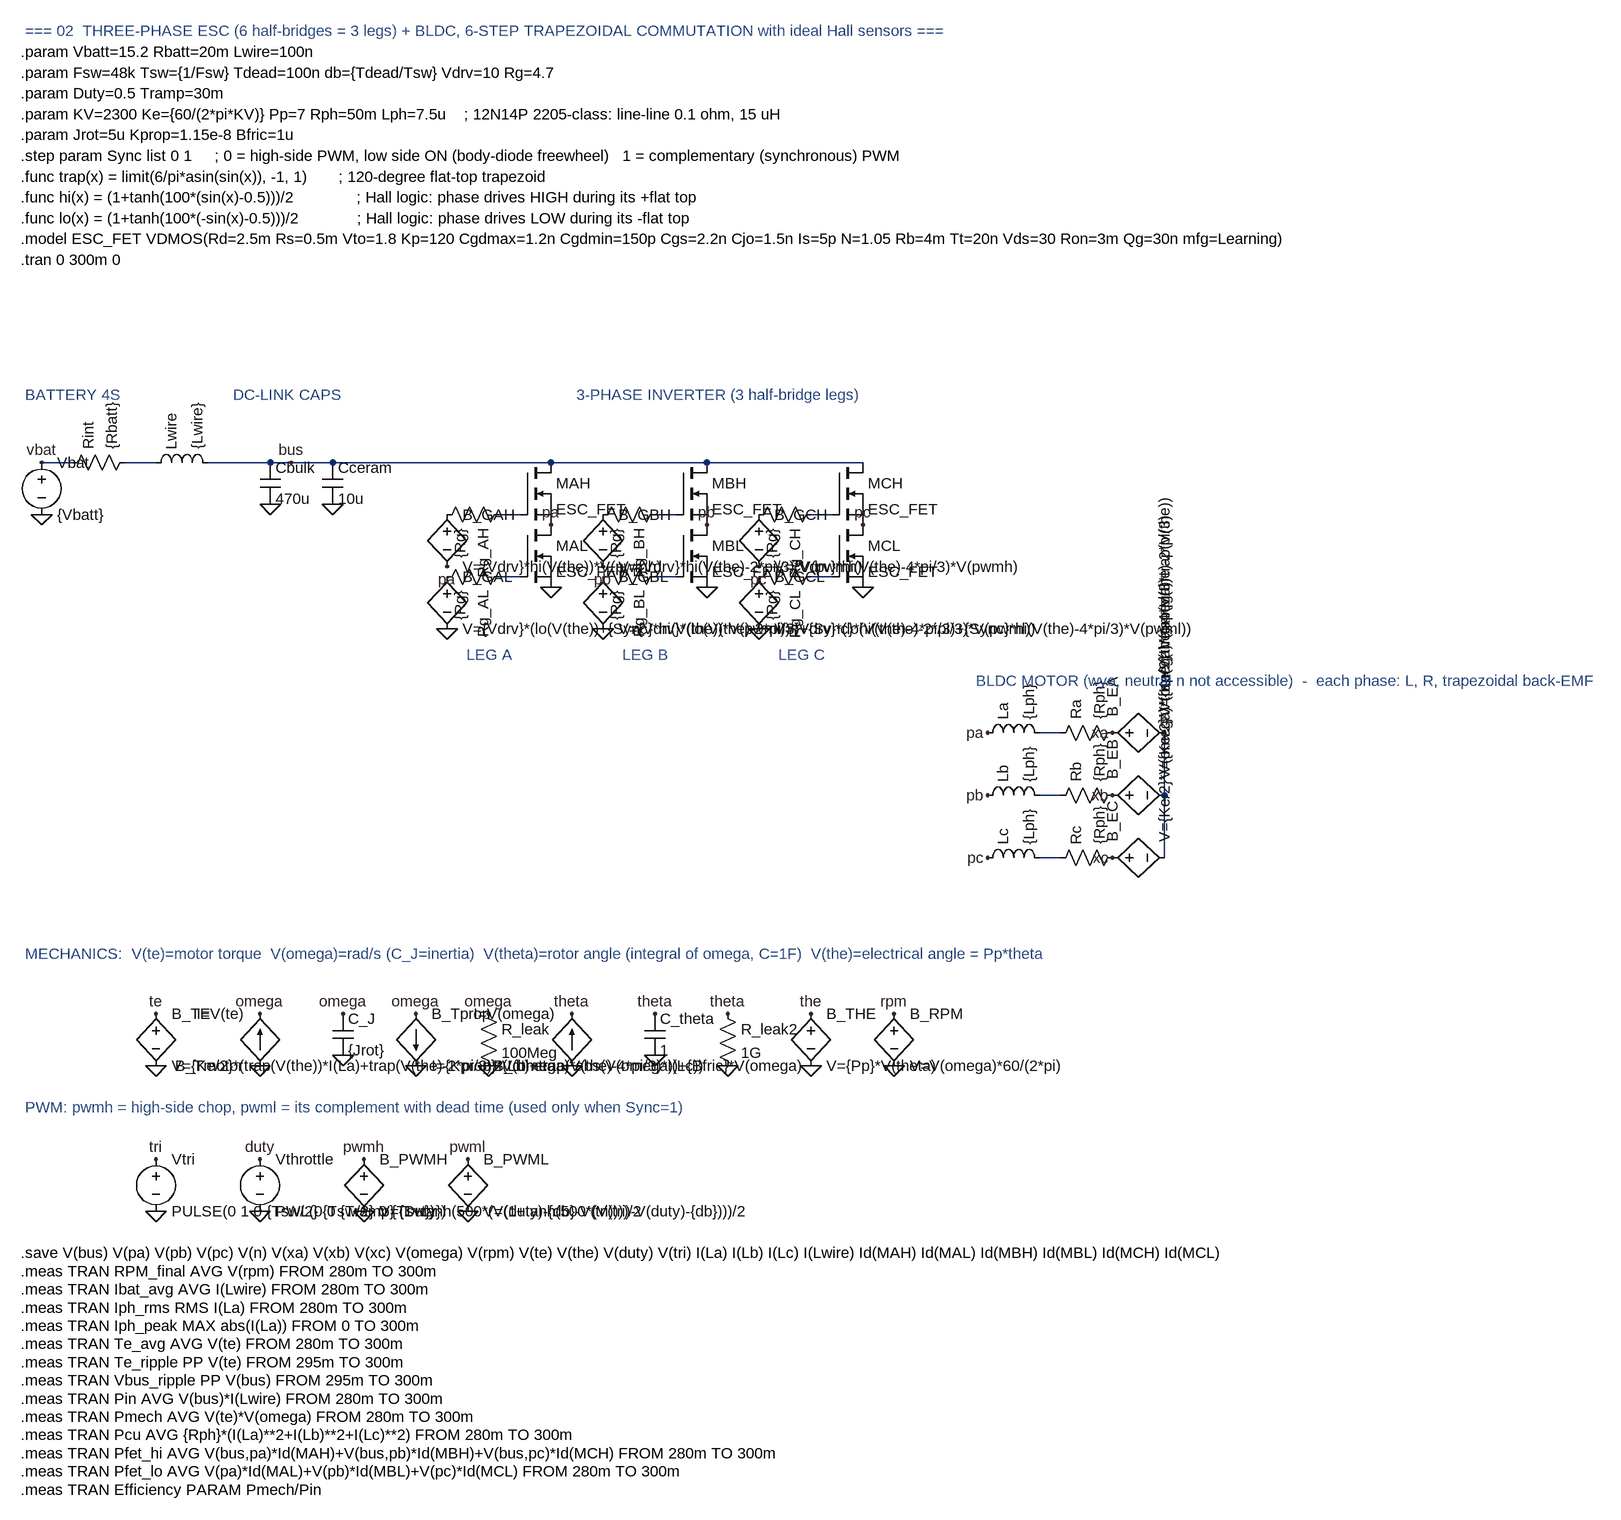
[diagram p0: schematic ThreePhase_ESC_BLDC.asc]
ThreePhase_ESC_BLDC.asc, the LTspice schematic file:
Version 4
SHEET 1 2200 1500
SYMBOL voltage 64 128 R0
SYMATTR InstName Vbat
SYMATTR Value {Vbatt}
FLAG 64 224 0
FLAG 64 144 vbat
SYMBOL res 96 160 R270
SYMATTR InstName Rint
SYMATTR Value {Rbatt}
WIRE 64 144 112 144
SYMBOL ind 224 160 R270
SYMATTR InstName Lwire
SYMATTR Value {Lwire}
SYMATTR SpiceLine Rser=2m
WIRE 192 144 240 144
SYMBOL cap 400 144 R0
SYMATTR InstName Cbulk
SYMATTR Value 470u
SYMATTR SpiceLine Rser=30m Lser=10n
FLAG 416 208 0
SYMBOL cap 496 144 R0
SYMATTR InstName Cceram
SYMATTR Value 10u
SYMATTR SpiceLine Rser=2m
FLAG 512 208 0
WIRE 320 144 1328 144
FLAG 448 144 bus
SYMBOL nmos 800 144 R0
SYMATTR InstName MAH
SYMATTR Value ESC_FET
SYMBOL nmos 800 240 R0
SYMATTR InstName MAL
SYMATTR Value ESC_FET
FLAG 848 336 0
FLAG 848 240 pa
SYMBOL res 784 208 R90
SYMATTR InstName Rg_AH
SYMATTR Value {Rg}
WIRE 768 224 800 224
SYMBOL res 784 304 R90
SYMATTR InstName Rg_AL
SYMATTR Value {Rg}
WIRE 768 320 800 320
SYMBOL bv 688 208 R0
SYMATTR InstName B_GAH
SYMATTR Value V={Vdrv}*hi(V(the))*V(pwmh)
FLAG 688 304 pa
SYMBOL bv 688 304 R0
SYMATTR InstName B_GAL
SYMATTR Value V={Vdrv}*(lo(V(the))+{Sync}*hi(V(the))*V(pwml))
FLAG 688 400 0
TEXT 704 440 Left 2 ;  LEG A
SYMBOL nmos 1040 144 R0
SYMATTR InstName MBH
SYMATTR Value ESC_FET
SYMBOL nmos 1040 240 R0
SYMATTR InstName MBL
SYMATTR Value ESC_FET
FLAG 1088 336 0
FLAG 1088 240 pb
SYMBOL res 1024 208 R90
SYMATTR InstName Rg_BH
SYMATTR Value {Rg}
WIRE 1008 224 1040 224
SYMBOL res 1024 304 R90
SYMATTR InstName Rg_BL
SYMATTR Value {Rg}
WIRE 1008 320 1040 320
SYMBOL bv 928 208 R0
SYMATTR InstName B_GBH
SYMATTR Value V={Vdrv}*hi(V(the)-2*pi/3)*V(pwmh)
FLAG 928 304 pb
SYMBOL bv 928 304 R0
SYMATTR InstName B_GBL
SYMATTR Value V={Vdrv}*(lo(V(the)-2*pi/3)+{Sync}*hi(V(the)-2*pi/3)*V(pwml))
FLAG 928 400 0
TEXT 944 440 Left 2 ;  LEG B
SYMBOL nmos 1280 144 R0
SYMATTR InstName MCH
SYMATTR Value ESC_FET
SYMBOL nmos 1280 240 R0
SYMATTR InstName MCL
SYMATTR Value ESC_FET
FLAG 1328 336 0
FLAG 1328 240 pc
SYMBOL res 1264 208 R90
SYMATTR InstName Rg_CH
SYMATTR Value {Rg}
WIRE 1248 224 1280 224
SYMBOL res 1264 304 R90
SYMATTR InstName Rg_CL
SYMATTR Value {Rg}
WIRE 1248 320 1280 320
SYMBOL bv 1168 208 R0
SYMATTR InstName B_GCH
SYMATTR Value V={Vdrv}*hi(V(the)-4*pi/3)*V(pwmh)
FLAG 1168 304 pc
SYMBOL bv 1168 304 R0
SYMATTR InstName B_GCL
SYMATTR Value V={Vdrv}*(lo(V(the)-4*pi/3)+{Sync}*hi(V(the)-4*pi/3)*V(pwml))
FLAG 1168 400 0
TEXT 1184 440 Left 2 ;  LEG C
FLAG 1520 560 pa
SYMBOL ind 1504 576 R270
SYMATTR InstName La
SYMATTR Value {Lph}
SYMBOL res 1616 576 R270
SYMATTR InstName Ra
SYMATTR Value {Rph}
WIRE 1600 560 1632 560
FLAG 1712 560 xa
SYMBOL bv 1696 560 R270
SYMATTR InstName B_EA
SYMATTR Value V={Ke/2}*V(omega)*trap(V(the))
FLAG 1520 656 pb
SYMBOL ind 1504 672 R270
SYMATTR InstName Lb
SYMATTR Value {Lph}
SYMBOL res 1616 672 R270
SYMATTR InstName Rb
SYMATTR Value {Rph}
WIRE 1600 656 1632 656
FLAG 1712 656 xb
SYMBOL bv 1696 656 R270
SYMATTR InstName B_EB
SYMATTR Value V={Ke/2}*V(omega)*trap(V(the)-2*pi/3)
FLAG 1520 752 pc
SYMBOL ind 1504 768 R270
SYMATTR InstName Lc
SYMATTR Value {Lph}
SYMBOL res 1616 768 R270
SYMATTR InstName Rc
SYMATTR Value {Rph}
WIRE 1600 752 1632 752
FLAG 1712 752 xc
SYMBOL bv 1696 752 R270
SYMATTR InstName B_EC
SYMATTR Value V={Ke/2}*V(omega)*trap(V(the)-4*pi/3)
WIRE 1792 560 1792 752
FLAG 1792 560 n
TEXT 1488 480 Left 2 ;  BLDC MOTOR (wye, neutral n not accessible)  -  each phase: L, R, trapezoidal back-EMF
SYMBOL bv 240 976 R0
SYMATTR InstName B_TE
SYMATTR Value V={Ke/2}*(trap(V(the))*I(La)+trap(V(the)-2*pi/3)*I(Lb)+trap(V(the)-4*pi/3)*I(Lc))
FLAG 240 992 te
FLAG 240 1072 0
SYMBOL bi 400 1072 R180
SYMATTR InstName B_Tmotor
SYMATTR Value I=V(te)
FLAG 400 1072 0
FLAG 400 992 omega
SYMBOL cap 512 992 R0
SYMATTR InstName C_J
SYMATTR Value {Jrot}
FLAG 528 992 omega
FLAG 528 1056 0
SYMBOL bi 640 992 R0
SYMATTR InstName B_Tprop
SYMATTR Value I={Kprop}*V(omega)*abs(V(omega))+{Bfric}*V(omega)
FLAG 640 992 omega
FLAG 640 1072 0
SYMBOL res 736 976 R0
SYMATTR InstName R_leak
SYMATTR Value 100Meg
FLAG 752 992 omega
FLAG 752 1072 0
SYMBOL bi 880 1072 R180
SYMATTR InstName B_dtheta
SYMATTR Value I=V(omega)
FLAG 880 1072 0
FLAG 880 992 theta
SYMBOL cap 992 992 R0
SYMATTR InstName C_theta
SYMATTR Value 1
FLAG 1008 992 theta
FLAG 1008 1056 0
SYMBOL res 1104 976 R0
SYMATTR InstName R_leak2
SYMATTR Value 1G
FLAG 1120 992 theta
FLAG 1120 1072 0
SYMBOL bv 1248 976 R0
SYMATTR InstName B_THE
SYMATTR Value V={Pp}*V(theta)
FLAG 1248 992 the
FLAG 1248 1072 0
SYMBOL bv 1376 976 R0
SYMATTR InstName B_RPM
SYMATTR Value V=V(omega)*60/(2*pi)
FLAG 1376 992 rpm
FLAG 1376 1072 0
TEXT 32 900 Left 2 ; MECHANICS:  V(te)=motor torque  V(omega)=rad/s (C_J=inertia)  V(theta)=rotor angle (integral of omega, C=1F)  V(the)=electrical angle = Pp*theta
SYMBOL voltage 240 1200 R0
SYMATTR InstName Vtri
SYMATTR Value PULSE(0 1 0 {Tsw/2} {Tsw/2} 0 {Tsw})
FLAG 240 1216 tri
FLAG 240 1296 0
SYMBOL voltage 400 1200 R0
SYMATTR InstName Vthrottle
SYMATTR Value PWL(0 0 {Tramp} {Duty})
FLAG 400 1216 duty
FLAG 400 1296 0
SYMBOL bv 560 1200 R0
SYMATTR InstName B_PWMH
SYMATTR Value V=(1+tanh(500*(V(duty)-{db}-V(tri))))/2
FLAG 560 1216 pwmh
FLAG 560 1296 0
SYMBOL bv 720 1200 R0
SYMATTR InstName B_PWML
SYMATTR Value V=(1+tanh(500*(V(tri)-V(duty)-{db})))/2
FLAG 720 1216 pwml
FLAG 720 1296 0
TEXT 32 1136 Left 2 ; PWM: pwmh = high-side chop, pwml = its complement with dead time (used only when Sync=1)
TEXT 32 -520 Left 2 ; === 02  THREE-PHASE ESC (6 half-bridges = 3 legs) + BLDC, 6-STEP TRAPEZOIDAL COMMUTATION with ideal Hall sensors ===
TEXT 32 -488 Left 2 !.param Vbatt=15.2 Rbatt=20m Lwire=100n
TEXT 32 -456 Left 2 !.param Fsw=48k Tsw={1/Fsw} Tdead=100n db={Tdead/Tsw} Vdrv=10 Rg=4.7
TEXT 32 -424 Left 2 !.param Duty=0.5 Tramp=30m
TEXT 32 -392 Left 2 !.param KV=2300 Ke={60/(2*pi*KV)} Pp=7 Rph=50m Lph=7.5u    ; 12N14P 2205-class: line-line 0.1 ohm, 15 uH
TEXT 32 -360 Left 2 !.param Jrot=5u Kprop=1.15e-8 Bfric=1u
TEXT 32 -328 Left 2 !.step param Sync list 0 1     ; 0 = high-side PWM, low side ON (body-diode freewheel)   1 = complementary (synchronous) PWM
TEXT 32 -296 Left 2 !.func trap(x) = limit(6/pi*asin(sin(x)), -1, 1)       ; 120-degree flat-top trapezoid
TEXT 32 -264 Left 2 !.func hi(x) = (1+tanh(100*(sin(x)-0.5)))/2              ; Hall logic: phase drives HIGH during its +flat top
TEXT 32 -232 Left 2 !.func lo(x) = (1+tanh(100*(-sin(x)-0.5)))/2             ; Hall logic: phase drives LOW during its -flat top
TEXT 32 -200 Left 2 !.model ESC_FET VDMOS(Rd=2.5m Rs=0.5m Vto=1.8 Kp=120 Cgdmax=1.2n Cgdmin=150p Cgs=2.2n Cjo=1.5n Is=5p N=1.05 Rb=4m Tt=20n Vds=30 Ron=3m Qg=30n mfg=Learning)
TEXT 32 -168 Left 2 !.tran 0 300m 0
TEXT 32 1360 Left 2 !.save V(bus) V(pa) V(pb) V(pc) V(n) V(xa) V(xb) V(xc) V(omega) V(rpm) V(te) V(the) V(duty) V(tri) I(La) I(Lb) I(Lc) I(Lwire) Id(MAH) Id(MAL) Id(MBH) Id(MBL) Id(MCH) Id(MCL)
TEXT 32 1388 Left 2 !.meas TRAN RPM_final AVG V(rpm) FROM 280m TO 300m
TEXT 32 1416 Left 2 !.meas TRAN Ibat_avg AVG I(Lwire) FROM 280m TO 300m
TEXT 32 1444 Left 2 !.meas TRAN Iph_rms RMS I(La) FROM 280m TO 300m
TEXT 32 1472 Left 2 !.meas TRAN Iph_peak MAX abs(I(La)) FROM 0 TO 300m
TEXT 32 1500 Left 2 !.meas TRAN Te_avg AVG V(te) FROM 280m TO 300m
TEXT 32 1528 Left 2 !.meas TRAN Te_ripple PP V(te) FROM 295m TO 300m
TEXT 32 1556 Left 2 !.meas TRAN Vbus_ripple PP V(bus) FROM 295m TO 300m
TEXT 32 1584 Left 2 !.meas TRAN Pin AVG V(bus)*I(Lwire) FROM 280m TO 300m
TEXT 32 1612 Left 2 !.meas TRAN Pmech AVG V(te)*V(omega) FROM 280m TO 300m
TEXT 32 1640 Left 2 !.meas TRAN Pcu AVG {Rph}*(I(La)**2+I(Lb)**2+I(Lc)**2) FROM 280m TO 300m
TEXT 32 1668 Left 2 !.meas TRAN Pfet_hi AVG V(bus,pa)*Id(MAH)+V(bus,pb)*Id(MBH)+V(bus,pc)*Id(MCH) FROM 280m TO 300m
TEXT 32 1696 Left 2 !.meas TRAN Pfet_lo AVG V(pa)*Id(MAL)+V(pb)*Id(MBL)+V(pc)*Id(MCL) FROM 280m TO 300m
TEXT 32 1724 Left 2 !.meas TRAN Efficiency PARAM Pmech/Pin
TEXT 32 40 Left 2 ; BATTERY 4S
TEXT 352 40 Left 2 ; DC-LINK CAPS
TEXT 880 40 Left 2 ; 3-PHASE INVERTER (3 half-bridge legs)

The netlist it stands for:
* ThreePhase_ESC_BLDC.asc
Vbat vbat 0 {Vbatt}
Rint vbat N001 {Rbatt}
Lwire N001 bus {Lwire} Rser=2m
Cbulk bus 0 470u Rser=30m Lser=10n
Cceram bus 0 10u Rser=2m
MAH bus N002 pa pa ESC_FET
MAL pa N003 0 0 ESC_FET
Rg_AH N002 P001 {Rg}
Rg_AL N003 P002 {Rg}
B_GAH P001 pa V={Vdrv}*hi(V(the))*V(pwmh)
B_GAL P002 0 V={Vdrv}*(lo(V(the))+{Sync}*hi(V(the))*V(pwml))
MBH bus N004 pb pb ESC_FET
MBL pb N005 0 0 ESC_FET
Rg_BH N004 P003 {Rg}
Rg_BL N005 P004 {Rg}
B_GBH P003 pb V={Vdrv}*hi(V(the)-2*pi/3)*V(pwmh)
B_GBL P004 0 V={Vdrv}*(lo(V(the)-2*pi/3)+{Sync}*hi(V(the)-2*pi/3)*V(pwml))
MCH bus N006 pc pc ESC_FET
MCL pc N007 0 0 ESC_FET
Rg_CH N006 P005 {Rg}
Rg_CL N007 P006 {Rg}
B_GCH P005 pc V={Vdrv}*hi(V(the)-4*pi/3)*V(pwmh)
B_GCL P006 0 V={Vdrv}*(lo(V(the)-4*pi/3)+{Sync}*hi(V(the)-4*pi/3)*V(pwml))
La pa N008 {Lph}
Ra N008 xa {Rph}
B_EA xa n V={Ke/2}*V(omega)*trap(V(the))
Lb pb N009 {Lph}
Rb N009 xb {Rph}
B_EB xb n V={Ke/2}*V(omega)*trap(V(the)-2*pi/3)
Lc pc N010 {Lph}
Rc N010 xc {Rph}
B_EC xc n V={Ke/2}*V(omega)*trap(V(the)-4*pi/3)
B_TE te 0 V={Ke/2}*(trap(V(the))*I(La)+trap(V(the)-2*pi/3)*I(Lb)+trap(V(the)-4*pi/3)*I(Lc))
B_Tmotor 0 omega I=V(te)
C_J omega 0 {Jrot}
B_Tprop omega 0 I={Kprop}*V(omega)*abs(V(omega))+{Bfric}*V(omega)
R_leak omega 0 100Meg
B_dtheta 0 theta I=V(omega)
C_theta theta 0 1
R_leak2 theta 0 1G
B_THE the 0 V={Pp}*V(theta)
B_RPM rpm 0 V=V(omega)*60/(2*pi)
Vtri tri 0 PULSE(0 1 0 {Tsw/2} {Tsw/2} 0 {Tsw})
Vthrottle duty 0 PWL(0 0 {Tramp} {Duty})
B_PWMH pwmh 0 V=(1+tanh(500*(V(duty)-{db}-V(tri))))/2
B_PWML pwml 0 V=(1+tanh(500*(V(tri)-V(duty)-{db})))/2
.model NMOS NMOS
.model PMOS PMOS
.lib standard.mos
*   LEG A
*   LEG B
*   LEG C
*   BLDC MOTOR (wye, neutral n not accessible)  -  each phase: L, R, trapezoidal back-EMF
*  MECHANICS:  V(te)=motor torque  V(omega)=rad/s (C_J=inertia)  V(theta)=rotor angle (integral of omega, C=1F)  V(the)=electrical angle = Pp*theta
*  PWM: pwmh = high-side chop, pwml = its complement with dead time (used only when Sync=1)
*  === 02  THREE-PHASE ESC (6 half-bridges = 3 legs) + BLDC, 6-STEP TRAPEZOIDAL COMMUTATION with ideal Hall sensors ===
.param Vbatt=15.2 Rbatt=20m Lwire=100n
.param Fsw=48k Tsw={1/Fsw} Tdead=100n db={Tdead/Tsw} Vdrv=10 Rg=4.7
.param Duty=0.5 Tramp=30m
.param KV=2300 Ke={60/(2*pi*KV)} Pp=7 Rph=50m Lph=7.5u    ; 12N14P 2205-class: line-line 0.1 ohm, 15 uH
.param Jrot=5u Kprop=1.15e-8 Bfric=1u
.step param Sync list 0 1     ; 0 = high-side PWM, low side ON (body-diode freewheel)   1 = complementary (synchronous) PWM
.func trap(x) = limit(6/pi*asin(sin(x)), -1, 1)       ; 120-degree flat-top trapezoid
.func hi(x) = (1+tanh(100*(sin(x)-0.5)))/2              ; Hall logic: phase drives HIGH during its +flat top
.func lo(x) = (1+tanh(100*(-sin(x)-0.5)))/2             ; Hall logic: phase drives LOW during its -flat top
.model ESC_FET VDMOS(Rd=2.5m Rs=0.5m Vto=1.8 Kp=120 Cgdmax=1.2n Cgdmin=150p Cgs=2.2n Cjo=1.5n Is=5p N=1.05 Rb=4m Tt=20n Vds=30 Ron=3m Qg=30n mfg=Learning)
.tran 0 300m 0
.save V(bus) V(pa) V(pb) V(pc) V(n) V(xa) V(xb) V(xc) V(omega) V(rpm) V(te) V(the) V(duty) V(tri) I(La) I(Lb) I(Lc) I(Lwire) Id(MAH) Id(MAL) Id(MBH) Id(MBL) Id(MCH) Id(MCL)
.meas TRAN RPM_final AVG V(rpm) FROM 280m TO 300m
.meas TRAN Ibat_avg AVG I(Lwire) FROM 280m TO 300m
.meas TRAN Iph_rms RMS I(La) FROM 280m TO 300m
.meas TRAN Iph_peak MAX abs(I(La)) FROM 0 TO 300m
.meas TRAN Te_avg AVG V(te) FROM 280m TO 300m
.meas TRAN Te_ripple PP V(te) FROM 295m TO 300m
.meas TRAN Vbus_ripple PP V(bus) FROM 295m TO 300m
.meas TRAN Pin AVG V(bus)*I(Lwire) FROM 280m TO 300m
.meas TRAN Pmech AVG V(te)*V(omega) FROM 280m TO 300m
.meas TRAN Pcu AVG {Rph}*(I(La)**2+I(Lb)**2+I(Lc)**2) FROM 280m TO 300m
.meas TRAN Pfet_hi AVG V(bus,pa)*Id(MAH)+V(bus,pb)*Id(MBH)+V(bus,pc)*Id(MCH) FROM 280m TO 300m
.meas TRAN Pfet_lo AVG V(pa)*Id(MAL)+V(pb)*Id(MBL)+V(pc)*Id(MCL) FROM 280m TO 300m
.meas TRAN Efficiency PARAM Pmech/Pin
*  BATTERY 4S
*  DC-LINK CAPS
*  3-PHASE INVERTER (3 half-bridge legs)
.backanno
.end